# Altium project ABPG.PrjPcb
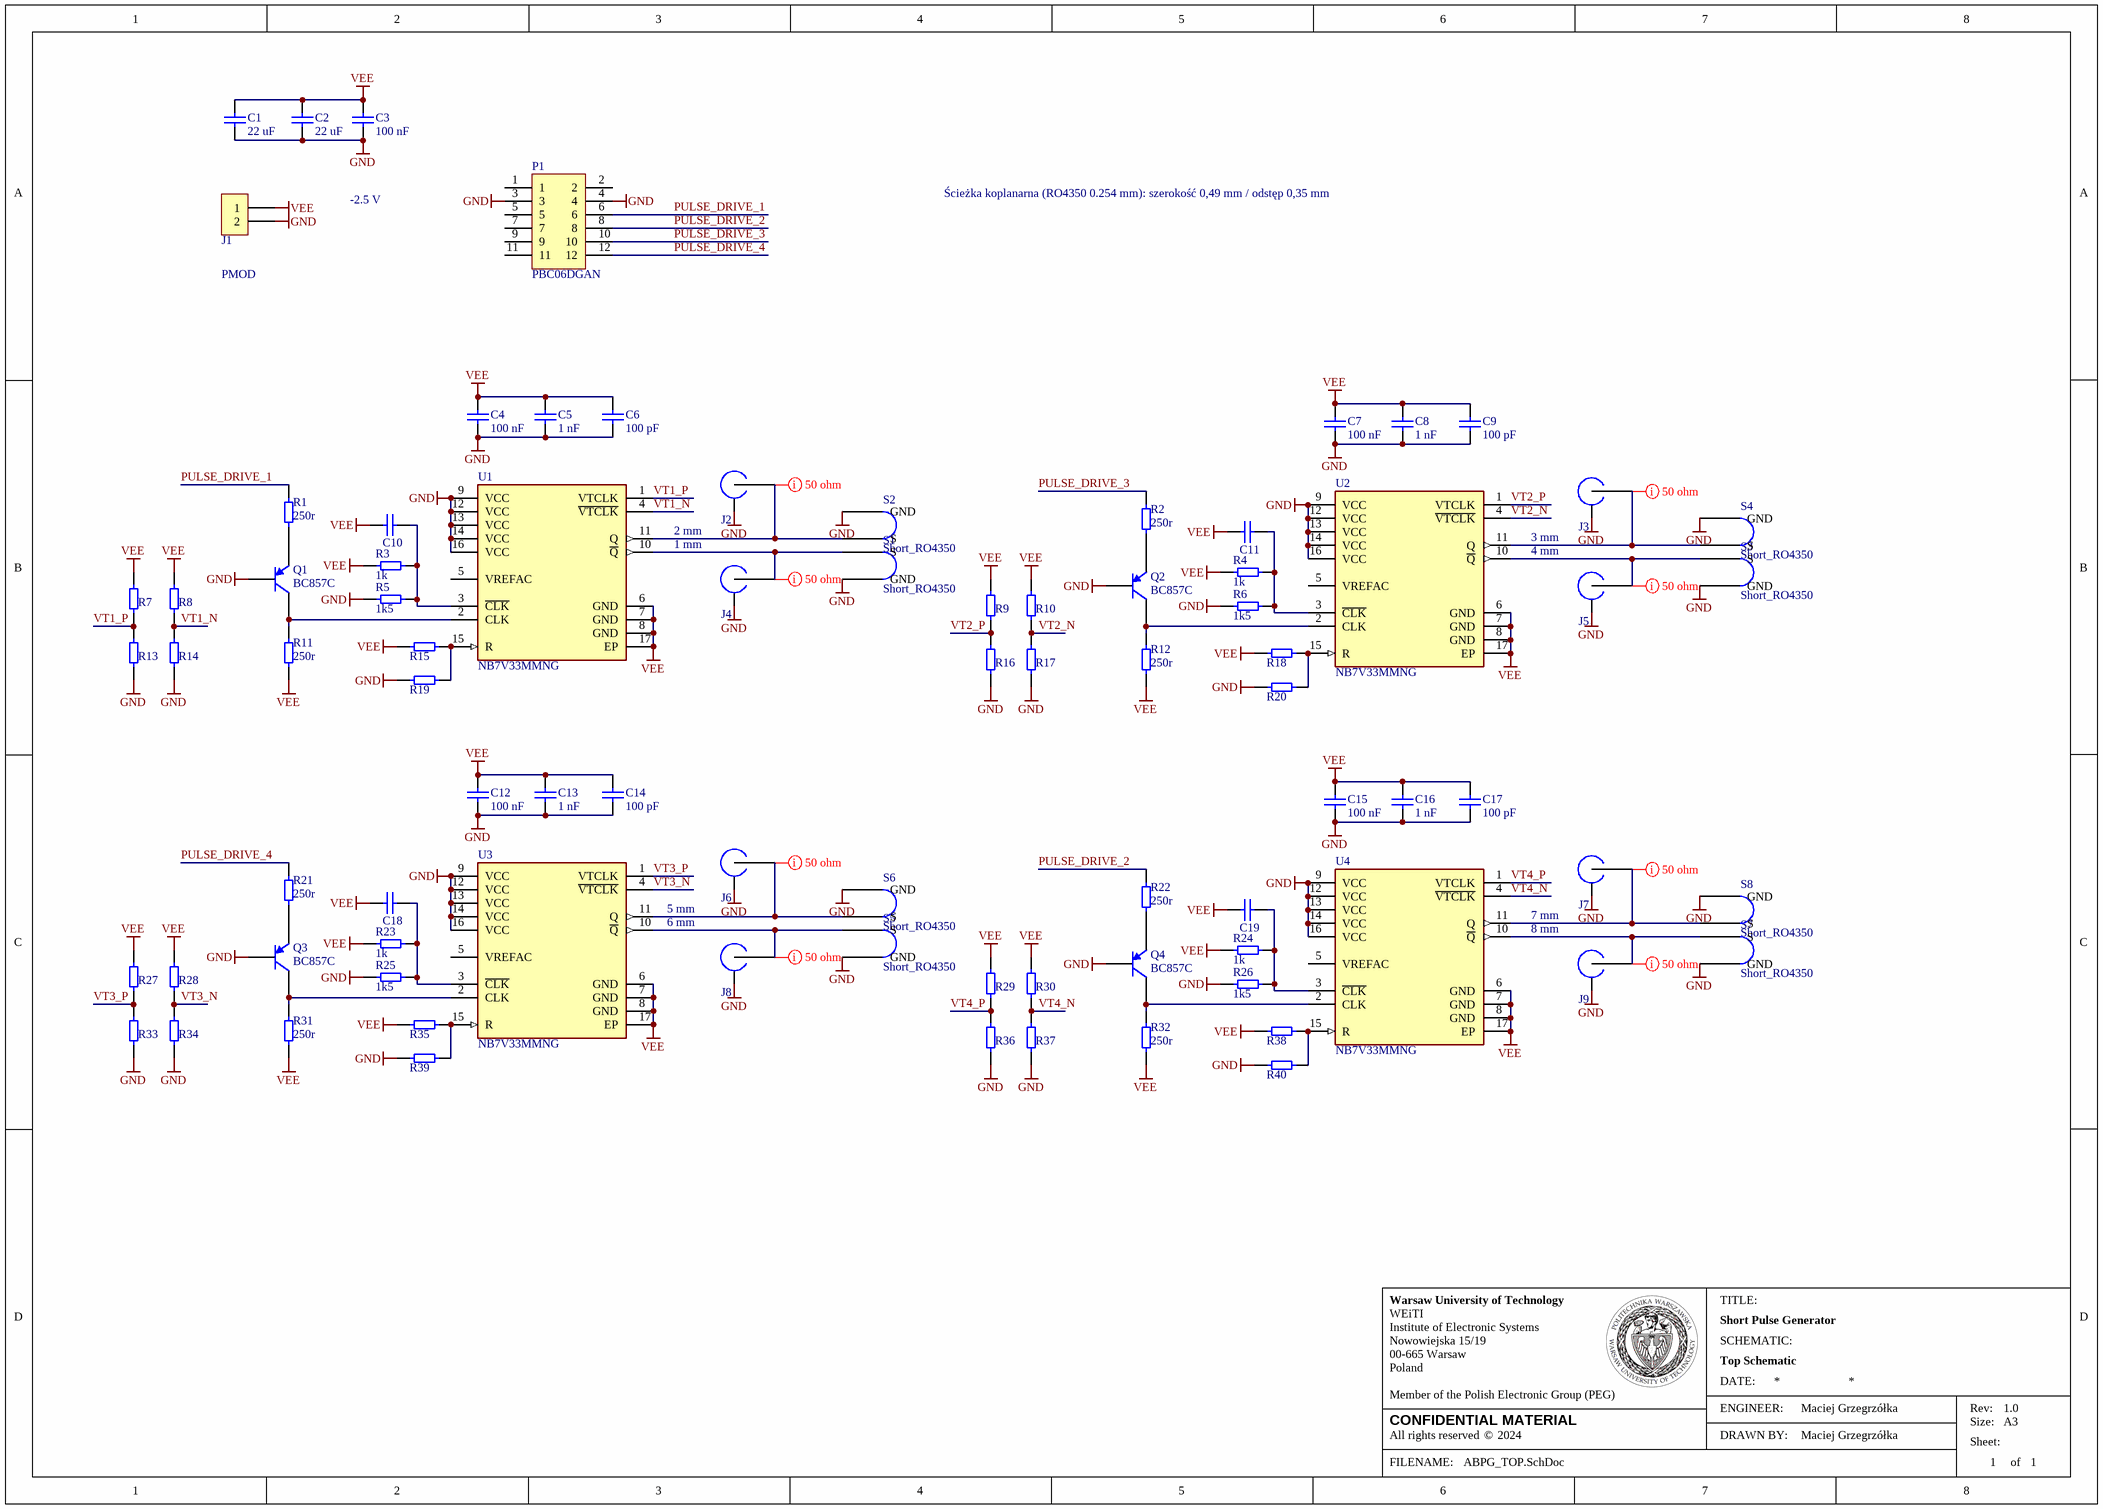
[diagram p0: ABPG_TOP.SchDoc]
Project_CopyrightDate: 2024; Project_DrawnBy: Maciej Grzegrzółka; Project_Engineer: Maciej Grzegrzółka; Project_Revision: 1.0; Project_Title: Short Pulse Generator
1 sheet, 85 parts. Net scope: global (net labels, ports and power ports of the same name join across sheets).
Board file: ABPG.PcbDoc

## Sheet ABPG_TOP.SchDoc
size A3; SheetNumber: 1; SheetTotal: 1; SchematicName: Top Schematic

### Parts
C1  22 uF  [C1210]
C2  22 uF  [C1210]
C3  100 nF  [C0402]
C4  100 nF  [C0402]
C5  1 nF  [C0402]
C6  100 pF  [C0402]
C7  100 nF  [C0402]
C8  1 nF  [C0402]
C9  100 pF  [C0402]
C10  100 nF  [0603-Capacitor]  (value not drawn)
C11  100 nF  [0603-Capacitor]  (value not drawn)
C12  100 nF  [C0402]
C13  1 nF  [C0402]
C14  100 pF  [C0402]
C15  100 nF  [C0402]
C16  1 nF  [C0402]
C17  100 pF  [C0402]
C18  100 nF  [0603-Capacitor]  (value not drawn)
C19  100 nF  [0603-Capacitor]  (value not drawn)
J1  1803426  [1803426]  (value not drawn)
J2  SF1621-60026  [SF1621-60026-RO4350-0.254]  (value not drawn)
J3  SF1621-60026  [SF1621-60026-RO4350-0.254]  (value not drawn)
J4  SF1621-60026  [SF1621-60026-RO4350-0.254]  (value not drawn)
J5  SF1621-60026  [SF1621-60026-RO4350-0.254]  (value not drawn)
J6  SF1621-60026  [SF1621-60026-RO4350-0.254]  (value not drawn)
J7  SF1621-60026  [SF1621-60026-RO4350-0.254]  (value not drawn)
J8  SF1621-60026  [SF1621-60026-RO4350-0.254]  (value not drawn)
J9  SF1621-60026  [SF1621-60026-RO4350-0.254]  (value not drawn)
P1  PBC06DGAN  [PBC06DGAN]
Q1  BC857C  [INF-SOT23_N]
Q2  BC857C  [INF-SOT23_N]
Q3  BC857C  [INF-SOT23_N]
Q4  BC857C  [INF-SOT23_N]
R1  250r  [0603-Resistor]
R2  250r  [0603-Resistor]
R3  1k  [0603-Resistor]
R4  1k  [0603-Resistor]
R5  1k5  [0603-Resistor]
R6  1k5  [0603-Resistor]
R7  DNP  [0603-Resistor]  (value not drawn)
R8  DNP  [0603-Resistor]  (value not drawn)
R9  DNP  [0603-Resistor]  (value not drawn)
R10  DNP  [0603-Resistor]  (value not drawn)
R11  250r  [0603-Resistor]
R12  250r  [0603-Resistor]
R13  DNP  [0603-Resistor]  (value not drawn)
R14  DNP  [0603-Resistor]  (value not drawn)
R15  *  [0603-Resistor]  (value not drawn)
R16  DNP  [0603-Resistor]  (value not drawn)
R17  DNP  [0603-Resistor]  (value not drawn)
R18  *  [0603-Resistor]  (value not drawn)
R19  *  [0603-Resistor]  (value not drawn)
R20  *  [0603-Resistor]  (value not drawn)
R21  250r  [0603-Resistor]
R22  250r  [0603-Resistor]
R23  1k  [0603-Resistor]
R24  1k  [0603-Resistor]
R25  1k5  [0603-Resistor]
R26  1k5  [0603-Resistor]
R27  DNP  [0603-Resistor]  (value not drawn)
R28  DNP  [0603-Resistor]  (value not drawn)
R29  DNP  [0603-Resistor]  (value not drawn)
R30  DNP  [0603-Resistor]  (value not drawn)
R31  250r  [0603-Resistor]
R32  250r  [0603-Resistor]
R33  DNP  [0603-Resistor]  (value not drawn)
R34  DNP  [0603-Resistor]  (value not drawn)
R35  *  [0603-Resistor]  (value not drawn)
R36  DNP  [0603-Resistor]  (value not drawn)
R37  DNP  [0603-Resistor]  (value not drawn)
R38  *  [0603-Resistor]  (value not drawn)
R39  *  [0603-Resistor]  (value not drawn)
R40  *  [0603-Resistor]  (value not drawn)
S1  Short_RO4350  [STD_SHORT]  (net tie, no BOM)
S2  Short_RO4350  [STD_SHORT]  (net tie, no BOM)
S3  Short_RO4350  [STD_SHORT]  (net tie, no BOM)
S4  Short_RO4350  [STD_SHORT]  (net tie, no BOM)
S5  Short_RO4350  [STD_SHORT]  (net tie, no BOM)
S6  Short_RO4350  [STD_SHORT]  (net tie, no BOM)
S7  Short_RO4350  [STD_SHORT]  (net tie, no BOM)
S8  Short_RO4350  [STD_SHORT]  (net tie, no BOM)
U1  NB7V33MMNG  [FP-485G-01-MFG]
U2  NB7V33MMNG  [FP-485G-01-MFG]
U3  NB7V33MMNG  [FP-485G-01-MFG]
U4  NB7V33MMNG  [FP-485G-01-MFG]

### Nets
GND: C1.2 C2.2 C3.2 C4.2 C5.2 C6.2 C7.2 C8.2 C9.2 C12.2 C13.2 C14.2 C15.2 C16.2 C17.2 J1.2 J2.0(GND) J3.0(GND) J4.0(GND) J5.0(GND) J6.0(GND) J7.0(GND) J8.0(GND) J9.0(GND) P1.3 P1.4 Q1.1(B) Q2.1(B) Q3.1(B) Q4.1(B) R5.2 R6.2 R13.2 R14.2 R16.2 R17.2 R19.2 R20.2 R25.2 R26.2 R33.2 R34.2 R36.2 R37.2 R39.2 R40.2 S1.0(GND) S2.0(GND) S3.0(GND) S4.0(GND) S5.0(GND) S6.0(GND) S7.0(GND) S8.0(GND) U1.9(VCC) U1.12(VCC) U1.13(VCC) U1.14(VCC) U1.16(VCC) U2.9(VCC) U2.12(VCC) U2.13(VCC) U2.14(VCC) U2.16(VCC) U3.9(VCC) U3.12(VCC) U3.13(VCC) U3.14(VCC) U3.16(VCC) U4.9(VCC) U4.12(VCC) U4.13(VCC) U4.14(VCC) U4.16(VCC)
VEE: C1.1 C2.1 C3.1 C4.1 C5.1 C6.1 C7.1 C8.1 C9.1 C10.1 C11.1 C12.1 C13.1 C14.1 C15.1 C16.1 C17.1 C18.1 C19.1 J1.1 R3.2 R4.2 R7.1 R8.1 R9.1 R10.1 R11.2 R12.2 R15.2 R18.2 R23.2 R24.2 R27.1 R28.1 R29.1 R30.1 R31.2 R32.2 R35.2 R38.2 U1.6(GND) U1.7(GND) U1.8(GND) U1.17(EP) U2.6(GND) U2.7(GND) U2.8(GND) U2.17(EP) U3.6(GND) U3.7(GND) U3.8(GND) U3.17(EP) U4.6(GND) U4.7(GND) U4.8(GND) U4.17(EP)
PULSE_DRIVE_1: P1.6 R1.2
PULSE_DRIVE_2: P1.8 R22.2
PULSE_DRIVE_3: P1.10 R2.2
PULSE_DRIVE_4: P1.12 R21.2
VT1_N: R8.2 R14.1 U1.4(~{VTCLK})
VT1_P: R7.2 R13.1 U1.1(VTCLK)
VT2_N: R10.2 R17.1 U2.4(~{VTCLK})
VT2_P: R9.2 R16.1 U2.1(VTCLK)
VT3_N: R28.2 R34.1 U3.4(~{VTCLK})
VT3_P: R27.2 R33.1 U3.1(VTCLK)
VT4_N: R30.2 R37.1 U4.4(~{VTCLK})
VT4_P: R29.2 R36.1 U4.1(VTCLK)
NetC10_2: C10.2 R3.1 R5.1 U1.3(~{CLK})
NetC11_2: C11.2 R4.1 R6.1 U2.3(~{CLK})
NetC18_2: C18.2 R23.1 R25.1 U3.3(~{CLK})
NetC19_2: C19.2 R24.1 R26.1 U4.3(~{CLK})
NetJ2_1: J2.1 S2.1(S) U1.11(Q)
NetJ3_1: J3.1 S4.1(S) U2.11(Q)
NetJ4_1: J4.1 S1.1(S) U1.10(~{Q})
NetJ5_1: J5.1 S3.1(S) U2.10(~{Q})
NetJ6_1: J6.1 S6.1(S) U3.11(Q)
NetJ7_1: J7.1 S8.1(S) U4.11(Q)
NetJ8_1: J8.1 S5.1(S) U3.10(~{Q})
NetJ9_1: J9.1 S7.1(S) U4.10(~{Q})
NetQ1_2: Q1.2(E) R1.1
NetQ1_3: Q1.3(C) R11.1 U1.2(CLK)
NetQ2_2: Q2.2(E) R2.1
NetQ2_3: Q2.3(C) R12.1 U2.2(CLK)
NetQ3_2: Q3.2(E) R21.1
NetQ3_3: Q3.3(C) R31.1 U3.2(CLK)
NetQ4_2: Q4.2(E) R22.1
NetQ4_3: Q4.3(C) R32.1 U4.2(CLK)
NetR15_1: R15.1 R19.1 U1.15(R)
NetR18_1: R18.1 R20.1 U2.15(R)
NetR35_1: R35.1 R39.1 U3.15(R)
NetR38_1: R38.1 R40.1 U4.15(R)

Not connected (* = marked no-connect by the designer): P1 1 2 5 7 9 11; U1 5(VREFAC); U2 5(VREFAC); U3 5(VREFAC); U4 5(VREFAC)

### Layout directives
net class 50 ohm: NetJ2_1, NetJ3_1, NetJ4_1, NetJ5_1, NetJ6_1, NetJ7_1, NetJ8_1, NetJ9_1

### Notes on the sheet
- -2.5 V
- Ścieżka koplanarna (RO4350 0.254 mm): szerokość 0,49 mm / odstęp 0,35 mm
- (near J1) PMOD
- 2 mm
- 1 mm
- 3 mm
- 4 mm
- 5 mm
- 7 mm
- 6 mm
- 8 mm
- WEiTI
- Warsaw University of Technology
- TITLE:
- 00-665 Warsaw
- Nowowiejska 15/19
- Institute of Electronic Systems
- Poland
- Member of the Polish Electronic Group (PEG)
- DATE:
- SCHEMATIC:
- All rights reserved
- CONFIDENTIAL MATERIAL
- ©
- ENGINEER:
- DRAWN BY:
- Size:
- Rev:
- Sheet:
- A3
- FILENAME:
- of

### Library data of the parts
C1-C9 C12-C17 = Capacitor: Manufacturer: *; ManufacturerNr: *; Voltage Rating: *; Dielectric: *; Tolerance: *
  C1 C2: Value: 22 uF; Package: 1210
  C3 C4 C7 C12 C15: Value: 100 nF; Package: 0402
  C5 C8 C13 C16: Value: 1 nF; Package: 0402
  C6 C9 C14 C17: Value: 100 pF; Package: 0402
C10 C11 C18 C19 = C0603: Capacitor; Part Number: C0603; Pin Count: 2; Manufacturer: *; Package: 0603; ManufacturerNr: *; Value: 100 nF; Voltage Rating: *; Dielectric: *
J1 = 1803426: 2 Position Terminal Block Header; Manufacturer: Phoenix Contact; Designator: J?; Part Number: 1803426; Component Kind: Standard; Component Type: Standard; Pin Count: 2; ManufacturerNr: 1803426; Footprint Type: Through hole
J2-J9 = SF1621-60026: CONN 2.4MM JACK STR 50OHM SCREW; Manufacturer: Amphenol; Part Number: SF1621-60026; Component Kind: Standard; Component Type: Standard; Designator: SF1621-60026; Footprint: SF1621-60026; Pin Count: 2; ManufacturerNr: SF1621-60026; Package: SF1621-60026; Footprint Type: SMD
P1 = PBC06DGAN: Double-row jumper plug (female) 5x2; Manufacturer: Sullins Connector Solutions; Designator: PPPC052LFBN-RC; Part Number: PBC06DGAN; Component Kind: Standard; Component Type: Standard; Pin Count: 12; ManufacturerNr: PBC06DGAN; Package: PBC06DGAN; Footprint Type: THD
Q1-Q4 = CMP-1177-00039-1: PNP Silicon AF Transistor, 45 V VCEO, 100 mA IC, SOT23, Reel, Green; Manufacturer: Infineon; VCBO (max): 50Â V; fT (typ): 250Â MHz; ICBO (max): 15Â nA; IC (max): 100Â mA; Green: TRUE; IBM (max): 200Â mA; VEBO (max): 5Â V; VCEO (max): 45Â V; Ptot (max): 330Â mW; PackageDescription: 3-Pin Small Outline Transistor Package, 1.3 x 2.9 mm Body, 0.95 mm Pitch; ComponentLink2Description: Datasheet; PackageReference: SOT23; ComponentLink3Description: Package Specification; ComponentLink1URL: http://www.infineon.com/; ComponentLink1Description: Manufacturer URL; Mounting Technology: Surface Mount; PackageVersion: Apr-08; ComponentLink3URL: http://www.infineon.com/dgdl/SOT23-Package_Overview.pdf?folderId=db3a30431936bc4b0119532290053c66&fileId=db3a30431936bc4b0119533468123c85; ComponentLink2URL: http://www.infineon.com/dgdl/bc857series_bc858series_bc859series_bc860series.pdf?folderId=db3a304314dca389011541d30fa21656&fileId=db3a304314dca389011541da0e3a1661; Polarity: PNP; ICM (max): 200Â mA; PartNumber: BC857C; Packing: Reel
R1-R40 = R0603: Resistor; Part Number: R0603; Pin Count: 2; Manufacturer: *; Package: 0603; ManufacturerNr: *
  R1 R2 R11 R12 R21 R22 R31 R32: Value: 250r
  R3 R4 R23 R24: Value: 1k
  R5 R6 R25 R26: Value: 1k5
  R7-R10 R13 R14 R16 R17 R27-R30 R33 R34 R36 R37: Value: DNP
  R15 R18-R20 R35 R38-R40: Value: *
U1-U4 = CMP-07066-000001-1: IC CLK DIVIDER 1:1 10GHZ 16QFN; Manufacturer: ON Semiconductor; Number Of Elements: 1; Propagation Delay: 0.26ns; Max Supply Voltage: 2.625V; Min Supply Voltage: 1.71V; Nominal Supply Current: 85-95mA; Standoff Height: 0mm; Mouser Description: Clock Drivers & Distribution 1.8V / 2.5V 10GHz; Lead Free: Yes; Ambient Temperature Range Low: -40°C; Digikey Description: IC CLK DIVIDER 1:1 10GHZ 16QFN; Temperature Range Low: -40°C; RoHS: TRUE; Device Class L1: Integrated Circuits (ICs); Device Class L2: Clock and Timing; Footprint Url: https://www.onsemi.com/pub/Collateral/485G-01.PDF; Height: 1mm; Device Class L3: Drivers; Manufacturer Part Number: NB7V33MMNG; ComponentLink2URL: https://www.onsemi.com/pub/Collateral/NB7V33M-D.PDF; Ambient Temperature Range High: +85°C; Ipc Land Pattern Name: QFN50P300X300X90-16; Package: 485G-01; Octopart: https://octopart.com/nb7v33mmng-on+semiconductor-15753900; Number Of Inputs: 1; Automotive: No; Category: IC; Number Of Outputs: 1; Temperature: -40°C to +85°C; Temperature Range High: +85°C; ComponentLink2Description: Datasheet